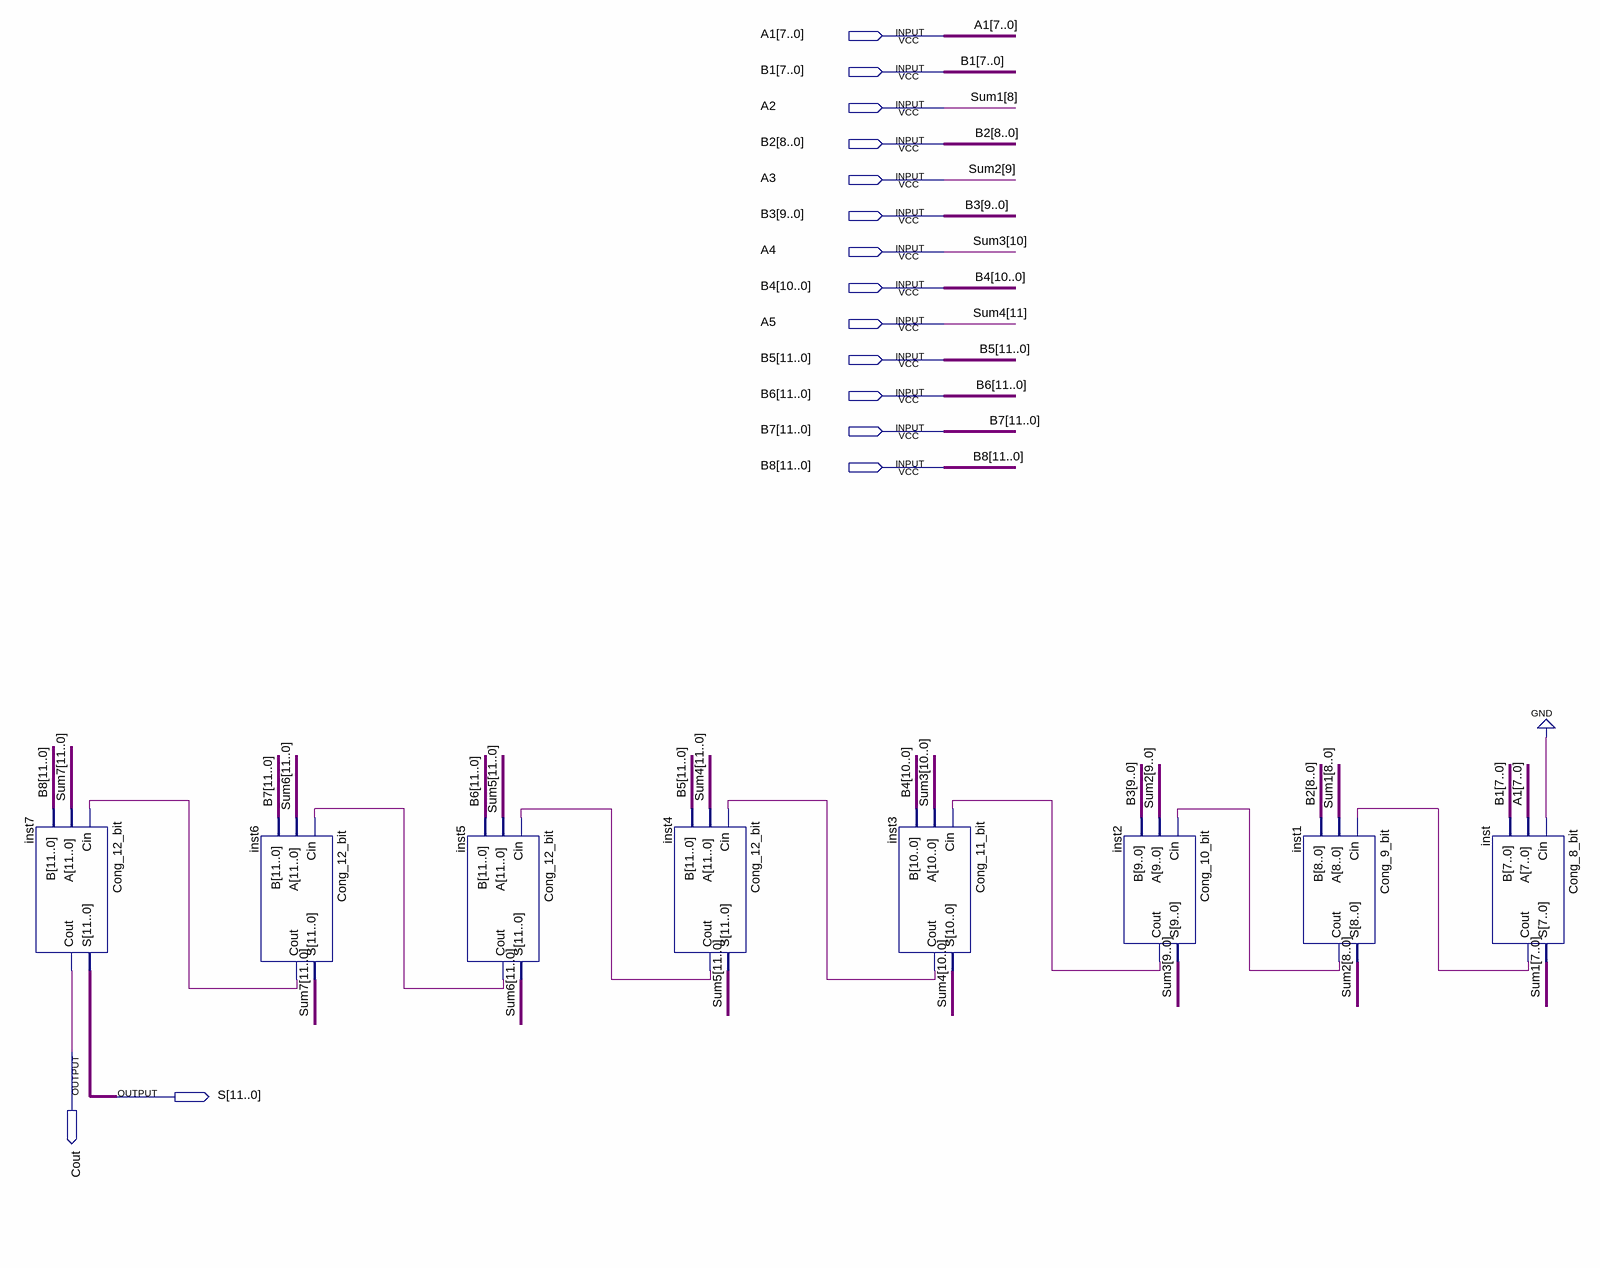
[diagram p0: schematic sheet]
// Quartus schematic Full_Adder_8_bit_spec.bdf as structural Verilog: 8 symbols, 15 pins
module Full_Adder_8_bit_spec (
  input  [7:0] A1,
  input  [7:0] B1,
  input  A2,
  input  [8:0] B2,
  input  A3,
  input  [9:0] B3,
  input  A4,
  input  [10:0] B4,
  input  A5,
  input  [11:0] B5,
  input  [11:0] B6,
  input  [11:0] B7,
  input  [11:0] B8,
  output Cout,
  output [11:0] S
);

  wire inst1_cout, inst2_cout, inst3_cout, inst4_cout, inst5_cout, inst6_cout, inst_cout;
  wire [7:0] Sum1;
  wire [8:0] Sum2;
  wire [9:0] Sum3;
  wire [10:0] Sum4;
  wire [11:0] Sum5, Sum6, Sum7;

  Cong_12_bit inst7 (.Cin(inst6_cout), .A(Sum7), .B(B8), .S(S), .Cout(Cout));
  Cong_12_bit inst6 (.Cin(inst5_cout), .A(Sum6), .B(B7), .S(Sum7), .Cout(inst6_cout));
  Cong_12_bit inst5 (.Cin(inst4_cout), .A(Sum5), .B(B6), .S(Sum6), .Cout(inst5_cout));
  Cong_12_bit inst4 (.Cin(inst3_cout), .A({A5, Sum4}), .B(B5), .S(Sum5), .Cout(inst4_cout));
  Cong_11_bit inst3 (.Cin(inst2_cout), .A({A4, Sum3}), .B(B4), .S(Sum4), .Cout(inst3_cout));
  Cong_10_bit inst2 (.Cin(inst1_cout), .A({A3, Sum2}), .B(B3), .S(Sum3), .Cout(inst2_cout));
  Cong_9_bit inst1 (.Cin(inst_cout), .A({A2, Sum1}), .B(B2), .S(Sum2), .Cout(inst1_cout));
  Cong_8_bit inst (.Cin(1'b0), .A(A1), .B(B1), .S(Sum1), .Cout(inst_cout));

  // Other names for the same wires on the sheet: Sum1[8] = A2; Sum2[9] = A3; Sum3[10] = A4; Sum4[11] = A5
endmodule
